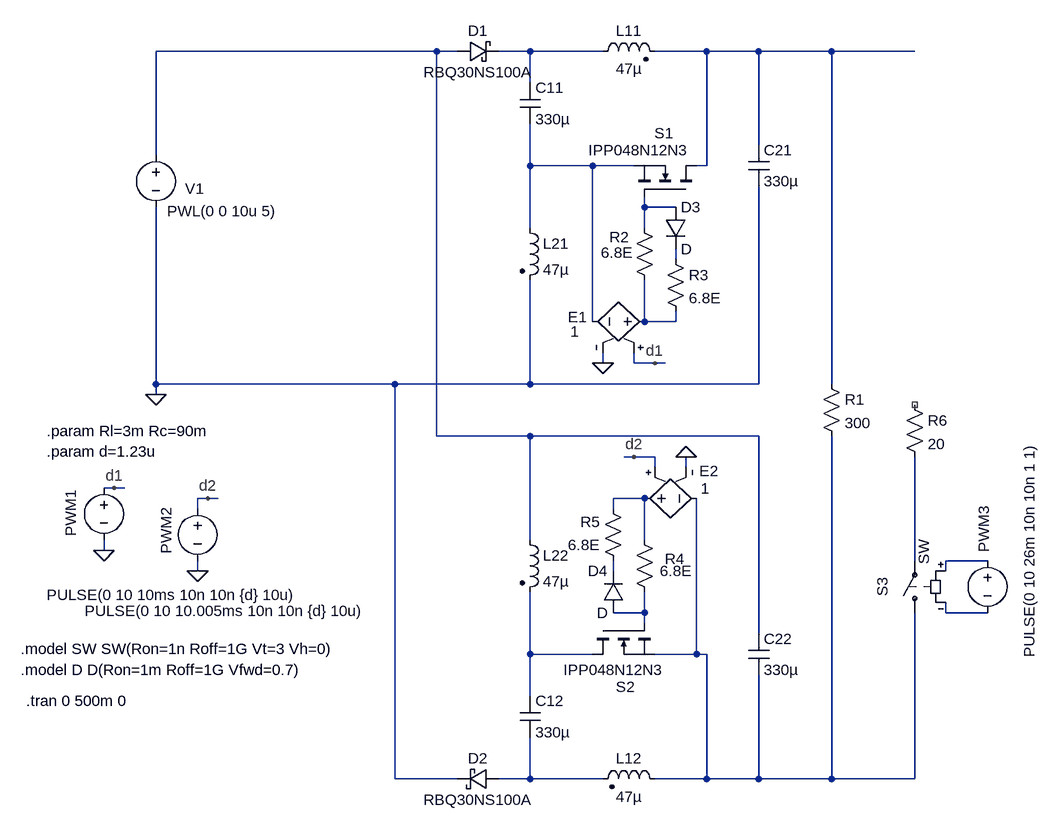
[diagram p0: schematic BC_Type3_real_mit_Treiber.asc]
BC_Type3_real_mit_Treiber.asc, the LTspice schematic file:
Version 4
SHEET 1 2984 1460
WIRE 112 96 -320 96
WIRE 144 96 112 96
WIRE 256 96 208 96
WIRE 368 96 256 96
WIRE 528 96 448 96
WIRE 608 96 528 96
WIRE 720 96 608 96
WIRE 848 96 720 96
WIRE 256 144 256 96
WIRE 608 240 608 96
WIRE -320 256 -320 96
WIRE 256 272 256 208
WIRE 352 272 256 272
WIRE 416 272 352 272
WIRE 528 272 528 96
WIRE 528 272 512 272
WIRE 432 336 432 320
WIRE 480 336 432 336
WIRE 256 368 256 272
WIRE 432 368 432 336
WIRE 480 416 480 400
WIRE 352 512 352 272
WIRE 432 512 432 448
WIRE 480 512 480 496
WIRE 480 512 432 512
WIRE 368 576 368 560
WIRE 416 576 416 560
WIRE 448 576 416 576
WIRE 464 576 448 576
WIRE -320 608 -320 336
WIRE 48 608 -320 608
WIRE 256 608 256 448
WIRE 256 608 48 608
WIRE 608 608 608 304
WIRE 608 608 256 608
WIRE 720 608 720 96
WIRE -320 624 -320 608
WIRE 112 688 112 96
WIRE 256 688 112 688
WIRE 608 688 256 688
WIRE 416 720 400 720
WIRE 448 720 416 720
WIRE 448 736 448 720
WIRE 496 736 496 720
WIRE -384 768 -400 768
WIRE -368 768 -384 768
WIRE -240 784 -256 784
WIRE -224 784 -240 784
WIRE 432 784 384 784
WIRE -256 800 -256 784
WIRE 384 800 384 784
WIRE 256 848 256 688
WIRE 432 848 432 784
WIRE -400 864 -400 848
WIRE 848 880 848 720
WIRE 960 880 896 880
WIRE -256 896 -256 880
WIRE 384 896 384 880
WIRE 896 896 896 880
WIRE 432 960 432 928
WIRE 432 960 384 960
WIRE 896 960 896 944
WIRE 960 960 896 960
WIRE 432 976 432 960
WIRE 608 992 608 688
WIRE 256 1024 256 928
WIRE 352 1024 256 1024
WIRE 512 1024 512 784
WIRE 512 1024 448 1024
WIRE 528 1024 512 1024
WIRE 256 1088 256 1024
WIRE 48 1216 48 608
WIRE 144 1216 48 1216
WIRE 256 1216 256 1152
WIRE 256 1216 208 1216
WIRE 368 1216 256 1216
WIRE 528 1216 528 1024
WIRE 528 1216 448 1216
WIRE 608 1216 608 1056
WIRE 608 1216 528 1216
WIRE 720 1216 720 688
WIRE 720 1216 608 1216
WIRE 848 1216 848 960
WIRE 848 1216 720 1216
FLAG -320 624 0
FLAG -400 864 0
FLAG -256 896 0
FLAG -384 768 d1
FLAG -240 784 d2
FLAG 368 576 0
FLAG 448 576 d1
FLAG 496 720 0
FLAG 416 720 d2
SYMBOL cap 240 144 R0
SYMATTR InstName C11
SYMATTR Value 330µ
SYMATTR SpiceLine Rser={Rc}
SYMBOL ind2 240 352 R0
SYMATTR InstName L21
SYMATTR Value 47µ
SYMATTR Type ind
SYMATTR SpiceLine Rser={Rl}
SYMBOL ind2 352 112 R270
WINDOW 0 32 56 VTop 2
WINDOW 3 5 56 VBottom 2
SYMATTR InstName L11
SYMATTR Value 47µ
SYMATTR Type ind
SYMATTR SpiceLine Rser={Rl}
SYMBOL cap 592 240 R0
SYMATTR InstName C21
SYMATTR Value 330µ
SYMATTR SpiceLine Rser={Rc}
SYMBOL cap 240 1088 R0
SYMATTR InstName C12
SYMATTR Value 330µ
SYMATTR SpiceLine Rser={Rc}
SYMBOL ind2 240 832 R0
SYMATTR InstName L22
SYMATTR Value 47µ
SYMATTR Type ind
SYMATTR SpiceLine Rser={Rl}
SYMBOL ind2 464 1232 M270
WINDOW 0 32 56 VTop 2
WINDOW 3 4 56 VBottom 2
SYMATTR InstName L12
SYMATTR Value 47µ
SYMATTR Type ind
SYMATTR SpiceLine Rser={Rl}
SYMBOL cap 592 992 R0
SYMATTR InstName C22
SYMATTR Value 330µ
SYMATTR SpiceLine Rser={Rc}
SYMBOL voltage -320 240 R0
WINDOW 123 0 0 Left 0
WINDOW 39 0 0 Left 0
WINDOW 0 45 67 Left 2
WINDOW 3 17 102 Left 2
SYMATTR InstName V1
SYMATTR Value PWL(0 0 10u 5)
SYMBOL res 704 592 R0
SYMATTR InstName R1
SYMATTR Value 300
SYMBOL voltage -400 752 R0
WINDOW 0 -35 55 VBottom 2
WINDOW 3 105 165 Top 2
WINDOW 123 0 0 Left 0
WINDOW 39 0 0 Left 0
SYMATTR InstName PWM1
SYMATTR Value PULSE(0 10 10ms 10n 10n {d} 10u)
SYMBOL voltage -256 784 R0
WINDOW 0 -64 50 VTop 2
WINDOW 3 43 189 Bottom 2
WINDOW 123 0 0 Left 0
WINDOW 39 0 0 Left 0
SYMATTR InstName PWM2
SYMATTR Value PULSE(0 10 10.005ms 10n 10n {d} 10u)
SYMBOL nmos 512 320 M270
WINDOW 0 98 65 VLeft 2
WINDOW 3 72 166 VLeft 2
SYMATTR InstName S1
SYMATTR Value IPP048N12N3
SYMBOL nmos 352 976 M90
WINDOW 0 98 65 VLeft 2
WINDOW 3 72 109 VLeft 2
SYMATTR InstName S2
SYMATTR Value IPP048N12N3
SYMBOL res 416 352 R0
WINDOW 0 -38 30 Left 2
WINDOW 3 -51 54 Left 2
SYMATTR InstName R2
SYMATTR Value 6.8E
SYMBOL diode 464 336 R0
SYMATTR InstName D3
SYMBOL res 464 400 R0
SYMATTR InstName R3
SYMATTR Value 6.8E
SYMBOL res 448 944 R180
WINDOW 0 -46 67 Left 2
WINDOW 3 -57 48 Left 2
SYMATTR InstName R4
SYMATTR Value 6.8E
SYMBOL diode 400 960 R180
WINDOW 0 24 64 Left 2
WINDOW 3 24 0 Left 2
SYMATTR InstName D4
SYMBOL res 400 896 R180
WINDOW 0 36 76 Left 2
WINDOW 3 36 40 Left 2
SYMATTR InstName R5
SYMATTR Value 6.8E
SYMBOL sw 848 976 R180
WINDOW 0 50 41 VRight 2
WINDOW 3 -14 90 VRight 2
SYMATTR InstName S3
SYMBOL voltage 960 864 R0
WINDOW 0 10 -32 VBottom 2
WINDOW 3 49 0 VTop 2
WINDOW 123 0 0 Left 0
WINDOW 39 0 0 Left 0
SYMATTR InstName PWM3
SYMATTR Value PULSE(0 10 26m 10n 10n 1 1)
SYMBOL res 832 624 R0
SYMATTR InstName R6
SYMATTR Value 20
SYMBOL schottky 144 112 R270
WINDOW 0 32 32 VTop 2
WINDOW 3 0 32 VBottom 2
SYMATTR InstName D1
SYMATTR Value RBQ30NS100A
SYMATTR Description Diode
SYMATTR Type diode
SYMBOL schottky 208 1200 R90
WINDOW 0 0 32 VBottom 2
WINDOW 3 32 32 VTop 2
SYMATTR InstName D2
SYMATTR Value RBQ30NS100A
SYMATTR Description Diode
SYMATTR Type diode
SYMBOL e 448 512 M270
WINDOW 0 7 134 VLeft 2
WINDOW 3 -15 130 VLeft 2
SYMATTR InstName E1
SYMATTR Value 1
SYMBOL e 416 784 M90
WINDOW 0 -42 130 VLeft 2
WINDOW 3 -15 116 VLeft 2
SYMATTR InstName E2
SYMATTR Value 1
TEXT -520 1096 Left 2 !.tran 0 500m 0
TEXT -528 1048 Left 2 !.model D D(Ron=1m Roff=1G Vfwd=0.7)
TEXT -528 1016 Left 2 !.model SW SW(Ron=1n Roff=1G Vt=3 Vh=0)
TEXT -488 680 Left 2 !.param Rl=3m Rc=90m
TEXT -488 712 Left 2 !.param d=1.23u

The netlist it stands for:
* BC_Type3_real_mit_Treiber.asc
C11 N002 N004 330µ Rser={Rc}
L21 N004 0 47µ Rser={Rl}
L11 N002 N003 47µ Rser={Rl}
C21 N003 0 330µ Rser={Rc}
C12 N014 N016 330µ Rser={Rc}
L22 N001 N014 47µ Rser={Rl}
L12 N015 N016 47µ Rser={Rl}
C22 N001 N015 330µ Rser={Rc}
V1 N001 0 PWL(0 0 10u 5)
R1 N003 N015 300
V§PWM1 d1 0 PULSE(0 10 10ms 10n 10n {d} 10u)
V§PWM2 d2 0 PULSE(0 10 10.005ms 10n 10n {d} 10u)
M§S1 N003 N005 N004 N004 IPP048N12N3
M§S2 N014 N012 N015 N015 IPP048N12N3
R2 N005 N007 6.8E
D3 N005 N006 D
R3 N006 N007 6.8E
R4 N012 N008 6.8E
D4 N012 N011 D
R5 N011 N008 6.8E
S3 N015 N009 N010 N013 SW
V§PWM3 N010 N013 PULSE(0 10 26m 10n 10n 1 1)
R6 NC_01 N009 20
D1 N001 N002 RBQ30NS100A
D2 N016 0 RBQ30NS100A
E1 N007 N004 d1 0 1
E2 N008 N015 d2 0 1
.model D D
.lib standard.dio
.model NMOS NMOS
.model PMOS PMOS
.lib standard.mos
.tran 0 500m 0
.model D D(Ron=1m Roff=1G Vfwd=0.7)
.model SW SW(Ron=1n Roff=1G Vt=3 Vh=0)
.param Rl=3m Rc=90m
.param d=1.23u
.backanno
.end